# Altium schematic sheet 4_Outputs_A.schdoc
size 297 x 209 mm; Symbol: Drawing-Symbol_A4; Device: Drawing-Symbol_A4; @Project Name: Irrigation Controller v2; @Page Count: 5; @Update Date: 2026-11-21; @Create Date: 2026-11-21; @Schematic Name: Schematic1; @Page No: 4; @Page Name: 4_Outputs_A; Company: EasyEDA.com; Version: V1.0; Page Size: A4; @Create Time: 17:28:45; @Update Time: 17:28:45; Border: 1; Width: 1170; Height: 825; Region Start: 1; X Region Count: 6; Y Region Count: 4; Blade Width: 10; Title Block Position: 3; @Board Name: Board1
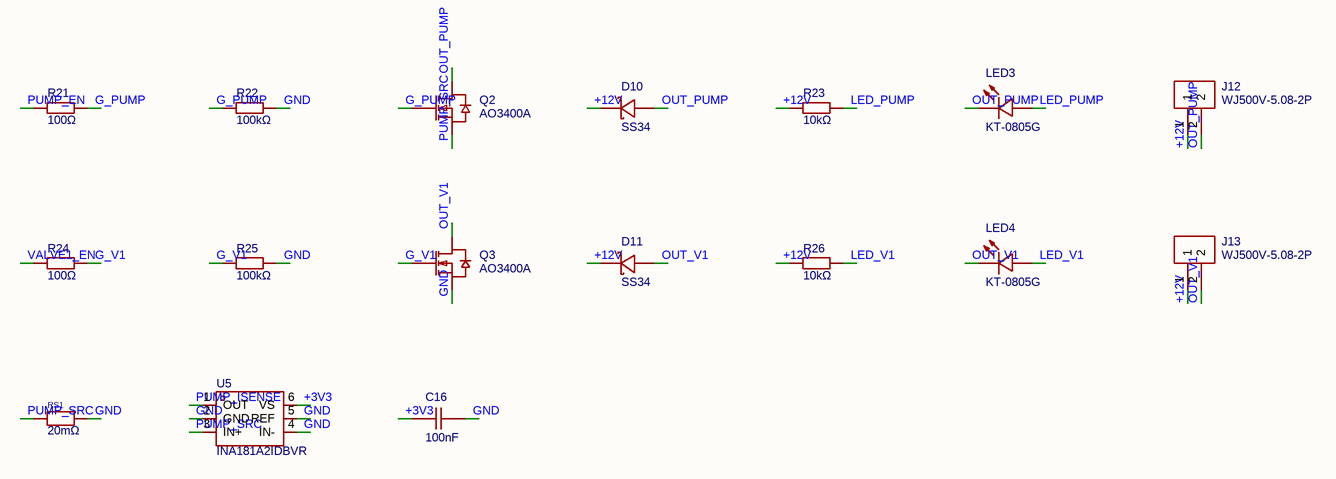
[diagram p0: 4_Outputs_A.schdoc]

## Parts
C16  100nF  [C0805]
D10  SS34  [SMA_L4.3-W2.6-LS5.2-RD]
D11  SS34  [SMA_L4.3-W2.6-LS5.2-RD]
J12  WJ500V-5.08-2P  [CONN-TH_2P-P5.00_WJ500V-5.08-2P]
J13  WJ500V-5.08-2P  [CONN-TH_2P-P5.00_WJ500V-5.08-2P]
LED3  KT-0805G  [LED0805-R-RD]
LED4  KT-0805G  [LED0805-R-RD]
Q2  AO3400A  [SOT-23-3_L2.9-W1.3-P1.90-LS2.4-BR]
Q3  AO3400A  [SOT-23-3_L2.9-W1.3-P1.90-LS2.4-BR]
R21  100Ω  [R0805]
R22  100kΩ  [R0805]
R23  10kΩ  [R0805]
R24  100Ω  [R0805]
R25  100kΩ  [R0805]
R26  10kΩ  [R0805]
RS1  20mΩ  [R2512]
U5  INA181A2IDBVR  [SOT-23-6_L2.9-W1.6-P0.95-LS2.8-BL]

## Nets
+3V3: C16.1 U5.6(VS)
+12V: D10.1(K) D11.1(K) J12.1 J13.1 R23.1 R26.1
G_PUMP: Q2.1(G) R21.2 R22.1
G_V1: Q3.1(G) R24.2 R25.1
GND: C16.2 Q3.2(S) R22.2 R25.2 RS1.2 U5.2(GND) U5.4(IN-) U5.5(REF)
LED_PUMP: LED3.1(A) R23.2
LED_V1: LED4.1(A) R26.2
OUT_PUMP: D10.2(A) J12.2 LED3.2(K) Q2.3(D)
OUT_V1: D11.2(A) J13.2 LED4.2(K) Q3.3(D)
PUMP_EN: R21.1
PUMP_ISENSE: U5.1(OUT)
PUMP_SRC: Q2.2(S) RS1.1 U5.3(IN+)
VALVE1_EN: R24.1

## Notes on the sheet
- Create at
- 2026-11-21
- Schematic
- Board
- Schematic1
- Board1
- Update at
- Page
- 4_Outputs_A
- Drawn
- Reviewed
- Irrigation Controller v2
- Version
- V1.0
- Size
- A4
- Page  4  Total  5
- EasyEDA.com

## Library data of the parts
C16 = CC0805KRX7R9BB104: Capacitance:100nF Tolerance:±10% Tolerance:±10% Voltage Rating:50V Temperature Coefficient:X7R; Manufacturer: YAGEO(国巨); Add into BOM: yes; PCB Layer: Default; Tolerance: ±10%; Voltage Rating: 50V; Temperature Coefficient: X7R; ModelId: 8c88e81f49c6409b980720ec8953afb6|0819f05c4eef4c71ace90d822a990e87; ModelName: C0805_L2.0-W1.3-H1.3; ModelTransform: 78.74,51.181,0,0,0,0,0,0.0005,0; Symbol: CC0805KRX7R9BB104; Device: CC0805KRX7R9BB104; Convert to PCB: yes; Manufacturer Part: CC0805KRX7R9BB104; Supplier: LCSC; Supplier Part: C49678; LCSC Part Name: 100nF ±10% 50V; Supplier Footprint: 0805; JLCPCB Part Class: Basic Part; Datasheet: https://item.szlcsc.com/datasheet/CC0805KRX7R9BB104/50686.html; Value: 100nF; FootprintName: C0805
D10 D11 = SS34_C8678: Diode Configuration:Standalone Voltage - Forward(Vf@If):550mV@3A Voltage - DC Reverse(Vr):40V Current - Rectified:3A Reverse Leakage Current (Ir):500uA@40V Operating Junction Temperature Range:-55℃~+125℃ Operating Junction Temperature Range:-55℃~+125℃ Non; Manufacturer: MDD(辰达半导体); Add into BOM: yes; PCB Layer: Default; Voltage - DC Reverse(Vr): 40V; Current - Rectified: 3A; Non-Repetitive Peak Forward Surge Current: 80A; ModelId: e3551acb3c5a4975a5e9d36087fe1fa2|0819f05c4eef4c71ace90d822a990e87; ModelTransform: 185.039,102.362,0,0,0,0,0,0,0; Symbol: SS34_C8678; Device: SS34_C8678; Convert to PCB: yes; Manufacturer Part: SS34; Supplier: LCSC; Supplier Part: C8678; LCSC Part Name: 电压:40V 电流:3A; Supplier Footprint: SMA(DO-214AC); JLCPCB Part Class: Basic Part; Datasheet: https://item.szlcsc.com/datasheet/SS34/9178.html; Diode Configuration: Standalone; Voltage - Forward(Vf@If): 550mV@3A; Reverse Leakage Current (Ir): 500uA@40V; Operating Junction Temperature Range: -55℃~+125℃; Power Dissipation: -; FootprintName: SMA_L4.3-W2.6-LS5.2-RD; ModelName: SMA_L4.3-W2.6-LS5.2-RD
J12 J13 = WJ500V-5.08-2P: Number of Positions or Pins:1x2P Pitch:5.08mm Color:Green Mounting Type:Through Hole Number of Pins:2P Number of Rows:1 Number of PINs Per Row:2 Screw Specification:M2.5 Current Rating:18A Voltage Rating (Max):250V Wire Gauge - AWG:14~30 Wire Gauge - mm2:; Manufacturer: KANGNEX(康奈克斯电气); Symbol: WJ500V-5.08-2P-14-00A; Add into BOM: yes; PCB Layer: Default; Number of Positions or Pins: 1x2P; Pitch: 5.08mm; Number of PINs Per Row: 2; Screw Specification: M2.5; Current Rating: 18A; Voltage Rating (Max): 250V; Wire Gauge - AWG: 14~30; Wire Gauge - mm2: 2.5; ModelId: 2bff34d19d2f4f9cb7f6a8b7d3be06fd|0819f05c4eef4c71ace90d822a990e87; ModelTransform: 423.621,393.7,0,0,0,0,-11.811,19.685,-137.795; Device: WJ500V-5.08-2P; Convert to PCB: yes; Manufacturer Part: WJ500V-5.08-2P; Supplier: LCSC; Supplier Part: C8465; LCSC Part Name: 1x2P 5.08mm 直插 排数:1 每排P数:2; Supplier Footprint: 插件,P=5.08mm; JLCPCB Part Class: Extended Part; Datasheet: https://item.szlcsc.com/datasheet/WJ500V-5.08-2P/8959.html; Color: Green; Mounting Type: Through Hole; Number of Pins: 2P; Number of Rows: 1; Operating Temperature: -40℃~+105℃; Height Above Board: 14.07mm; FootprintName: CONN-TH_2P-P5.00_WJ500V-5.08-2P; ModelName: CONN-TH_2P-P5.00_WJ500V-5.08-2P
LED3 LED4 = KT-0805G: Lamp Holder Type:2mm x 1.25mm square LED Illumination Color:Emerald Green Voltage - Forward(Vf):2.6V~3.1V Voltage - Forward(Vf):2.6V~3.1V Power(Watts):100mW Forward Current:5mA Wavelength - Dominant:513nm~528nm Wavelength - Dominant:513nm~528nm Peak Wavel; Manufacturer: KENTO; Symbol: 0805G (Green); Add into BOM: yes; PCB Layer: Default; Power(Watts): 100mW; Forward Current: 5mA; Peak Wavelength: 525nm; Diode Configuration: Discrete Diode; Lens Color: Water Clear; Luminous Intensity: 430mcd; Viewing Angle: 120°; ModelId: 167045bb0eae412b9d5564860e113a91|0819f05c4eef4c71ace90d822a990e87; ModelName: LED0805-RD; ModelTransform: 79.527,49.2125,0,0,0,0,0,0,0; Device: KT-0805G; Convert to PCB: yes; Manufacturer Part: KT-0805G; Supplier: LCSC; Supplier Part: C2297; LCSC Part Name: 0805 翠绿 高亮; Supplier Footprint: 0805; JLCPCB Part Class: Basic Part; Datasheet: https://item.szlcsc.com/datasheet/KT-0805G/2670.html; Lamp Holder Type: 2mm x 1.25mm square LED; Illumination Color: Emerald Green; Voltage - Forward(Vf): 2.6V~3.1V; Wavelength - Dominant: 513nm~528nm; Color Temperature: -; Mounting Style: -; Operating Temperature: -40℃~+85℃; FootprintName: LED0805-R-RD
Q2 Q3 = AO3400A_C20917: Number:1 N-channel Drain to Source Voltage:30V Current - Continuous Drain(Id):5.7A RDS(on):48mΩ@2.5V Pd - Power Dissipation:1.4W Gate Threshold Voltage (Vgs(th)):1.45V Gate Charge(Qg):7nC@10V Input Capacitance(Ciss):630pF Reverse Transfer Capacitance (Crs; Manufacturer: AOS; Add into BOM: yes; PCB Layer: Default; Drain to Source Voltage: 30V; Current - Continuous Drain(Id): 5.7A; Pd - Power Dissipation: 1.4W; Gate Threshold Voltage (Vgs(th)): 1.45V; Input Capacitance(Ciss): 630pF; Reverse Transfer Capacitance (Crss@Vds): 50pF; Output Capacitance(Coss): 75pF; Vgs: ±12V; ModelId: 62a57c6760504a01965db6419a6d07df|0819f05c4eef4c71ace90d822a990e87; ModelName: SOT-23-3P_L2.9-W1.3-H1.0-LS2.4-P0.95; ModelTransform: 98.425,114.173,0,180,0,0,0.0005,-0.0005,0; Symbol: AO3400A; Device: AO3400A_C20917; Convert to PCB: yes; Manufacturer Part: AO3400A; Supplier: LCSC; Supplier Part: C20917; LCSC Part Name: N沟道 耐压:30V; Supplier Footprint: SOT-23; JLCPCB Part Class: Basic Part; Datasheet: https://item.szlcsc.com/datasheet/AO3400A/21629.html; Number: 1 N-channel; RDS(on): 48mΩ@2.5V; Gate Charge(Qg): 7nC@10V; Operating Temperature: -55℃~+150℃; Configuration: -; Type: N-Channel; FootprintName: SOT-23-3_L2.9-W1.3-P1.90-LS2.4-BR
R21 R24 = 0805W8F1000T5E_C17408: Type:Thick Film Resistors Resistance: Tolerance:±1% Tolerance:±1% Power(Watts): Overload Voltage (Max): Temperature Coefficient:±100ppm/℃ Temperature Coefficient:±100ppm/℃ Operating Temperature Range:-55℃~+155℃ Operating Temperature Range:-55℃~+155℃; Manufacturer: UNI-ROYAL(厚声); Add into BOM: yes; PCB Layer: Default; Tolerance: ±1%; ModelId: b83c7c5430874b8eb2319a65d9433429|0819f05c4eef4c71ace90d822a990e87; ModelName: R0805_L2.0-W1.3-H0.6; ModelTransform: 78.74,51.181,0,0,0,0,0,-0.0005,0; Symbol: 0805W8F1000T5E; Device: 0805W8F1000T5E_C17408; Convert to PCB: yes; Manufacturer Part: 0805W8F1000T5E; Supplier: LCSC; Supplier Part: C17408; LCSC Part Name: 100Ω ±1% 125mW 厚膜电阻; Supplier Footprint: 0805; JLCPCB Part Class: Basic Part; Datasheet: https://atta.szlcsc.com/upload/public/pdf/source/20200306/C422600_1E6D84923E4A46A82E41ADD87F860B5C.pdf; Type: Thick Film Resistors; Value: 100Ω; Temperature Coefficient: ±100ppm/℃; Operating Temperature Range: -55℃~+155℃; FootprintName: R0805
R22 R25 = 0805W8F1003T5E (SMT业务专用): Type: Resistance: Tolerance:±1% Tolerance:±1% Power(Watts):- Overload Voltage (Max):-; Manufacturer: UNI-ROYAL(厚声); Add into BOM: yes; PCB Layer: Default; Tolerance: ±1%; ModelId: b83c7c5430874b8eb2319a65d9433429|0819f05c4eef4c71ace90d822a990e87; ModelName: R0805_L2.0-W1.3-H0.6; ModelTransform: 78.74,51.181,0,0,0,0,0,-0.0005,0; Symbol: 0805W8F1003T5E; Device: 0805W8F1003T5E (SMT业务专用); Convert to PCB: yes; Manufacturer Part: 0805W8F1003T5E (SMT业务专用); Supplier: LCSC; Supplier Part: C17407; LCSC Part Name: 100kΩ ±1%; Supplier Footprint: 0805; JLCPCB Part Class: Extended Part; Datasheet: https://atta.szlcsc.com/upload/public/pdf/source/20200102/C423413_58AC64FF5730584578C10BF0002471B1.pdf; Value: 100kΩ; Power(Watts): -; Overload Voltage (Max): -; FootprintName: R0805
R23 R26 = 0805W8F1002T5E: Type:Thick Film Resistor Resistance:10kΩ Tolerance:±1% Tolerance:±1% Power(Watts):125mW Voltage-Supply(Max):150V Temperature Coefficient:±100ppm/℃ Temperature Coefficient:±100ppm/℃ Operating Temperature:-55℃~+155℃ Operating Temperature:-55℃~+155℃; Manufacturer: UNI-ROYAL(厚声); Add into BOM: yes; PCB Layer: Default; Tolerance: ±1%; Power(Watts): 125mW; Voltage-Supply(Max): 150V; ModelId: b83c7c5430874b8eb2319a65d9433429|0819f05c4eef4c71ace90d822a990e87; ModelName: R0805_L2.0-W1.3-H0.6; ModelTransform: 78.74,51.181,0,0,0,0,0,-0.0005,0; Symbol: 0805W8F1002T5E; Device: 0805W8F1002T5E; Convert to PCB: yes; Manufacturer Part: 0805W8F1002T5E; Supplier: LCSC; Supplier Part: C17414; LCSC Part Name: 厚膜电阻 10kΩ ±1%; Supplier Footprint: 0805; JLCPCB Part Class: Basic Part; Datasheet: https://item.szlcsc.com/datasheet/0805W8F1002T5E/18102.html; Type: Thick Film Resistor; Value: 10kΩ; Temperature Coefficient: ±100ppm/℃; Operating Temperature: -55℃~+155℃; FootprintName: R0805
RS1 = HoJLR2512-2W-20mR-1%-75ppm: Type:Current Sense Resistor Resistance:20mΩ Tolerance:±1% Tolerance:±1% Power(Watts):2W Mounting Type:Surface Mount; Manufacturer: Milliohm(毫欧); Add into BOM: yes; PCB Layer: Default; Tolerance: ±1%; Power(Watts): 2W; ModelId: c704f12ea0da45b6b9e7d0ddac98e7f7|0819f05c4eef4c71ace90d822a990e87; ModelName: R2512_L6.3-W3.2-H0.6; ModelTransform: 248.031,125.984,0,0,0,0,-0.0005,0,0; Symbol: HOJLR2512-2W-20MR-1%-75PPM; Device: HoJLR2512-2W-20mR-1%-75ppm; Convert to PCB: yes; Manufacturer Part: HoJLR2512-2W-20mR-1%-75ppm; Supplier: LCSC; Supplier Part: C2924538; Value: 20mΩ; JLCPCB Part Class: Extended Part; LCSC Part Name: 20mΩ ±1% 2W; Supplier Footprint: 2512; Datasheet: https://item.szlcsc.com/datasheet/HoJLR2512-2W-20mR-1%2525-75ppm/3241104.html; Type: Current Sense Resistor; Mounting Type: Surface Mount; FootprintName: R2512
U5 = INA181A2IDBVR: Number of Channels:1 Vcm - Common Mode Voltage:-200mV~26V Vcm - Common Mode Voltage:-200mV~26V Gain:50V/V Bandwidth:210kHz Ib - Input Bias Current:6uA Vos - Input Offset Voltage:25uV Operating Temperature:-40℃~+125℃ Operating Temperature:-40℃~+125℃ Differ; Manufacturer: TI(德州仪器); Add into BOM: yes; PCB Layer: Default; Number of Channels: 1; Gain: 50V/V; Bandwidth: 210kHz; Ib - Input Bias Current: 6uA; Vos - Input Offset Voltage: 25uV; Differential Voltage: ±26V; Single Supply: 2.7V~5.5V; Quiescent Current: 195uA; Output Current: 8mA; Input Offset Voltage Drift(Vos TC): 1uV/℃; Slew Rate: 2V/us; Common Mode Rejection Ratio (CMRR): 100dB; Noise density(eN): 40nV/√Hz@1kHz; ModelId: 1370be37a17e44418ae52e2b4cc1f5e5|0819f05c4eef4c71ace90d822a990e87; ModelName: SOT-23-6_L2.9-W1.6-H1.5-LS2.8-P0.95; ModelTransform: 110.236,113.364,0,90,0,0,0.0005,0.0005,0; Symbol: INA181A2IDBVR; Device: INA181A2IDBVR; Convert to PCB: yes; Manufacturer Part: INA181A2IDBVR; Supplier: LCSC; Supplier Part: C2058784; LCSC Part Name: 双向低侧和高侧电压输出电流感应放大器; Supplier Footprint: SOT-23-6; JLCPCB Part Class: Extended Part; Datasheet: https://www.ti.com/cn/lit/ds/symlink/ina4181.pdf; Vcm - Common Mode Voltage: -200mV~26V; Operating Temperature: -40℃~+125℃; Features: Analog output interface；Bidirectional detection；Programmable output reference level; FootprintName: SOT-23-6_L2.9-W1.6-P0.95-LS2.8-BL